# Altium project Main_Board.PrjPcb (part 18 of 44)
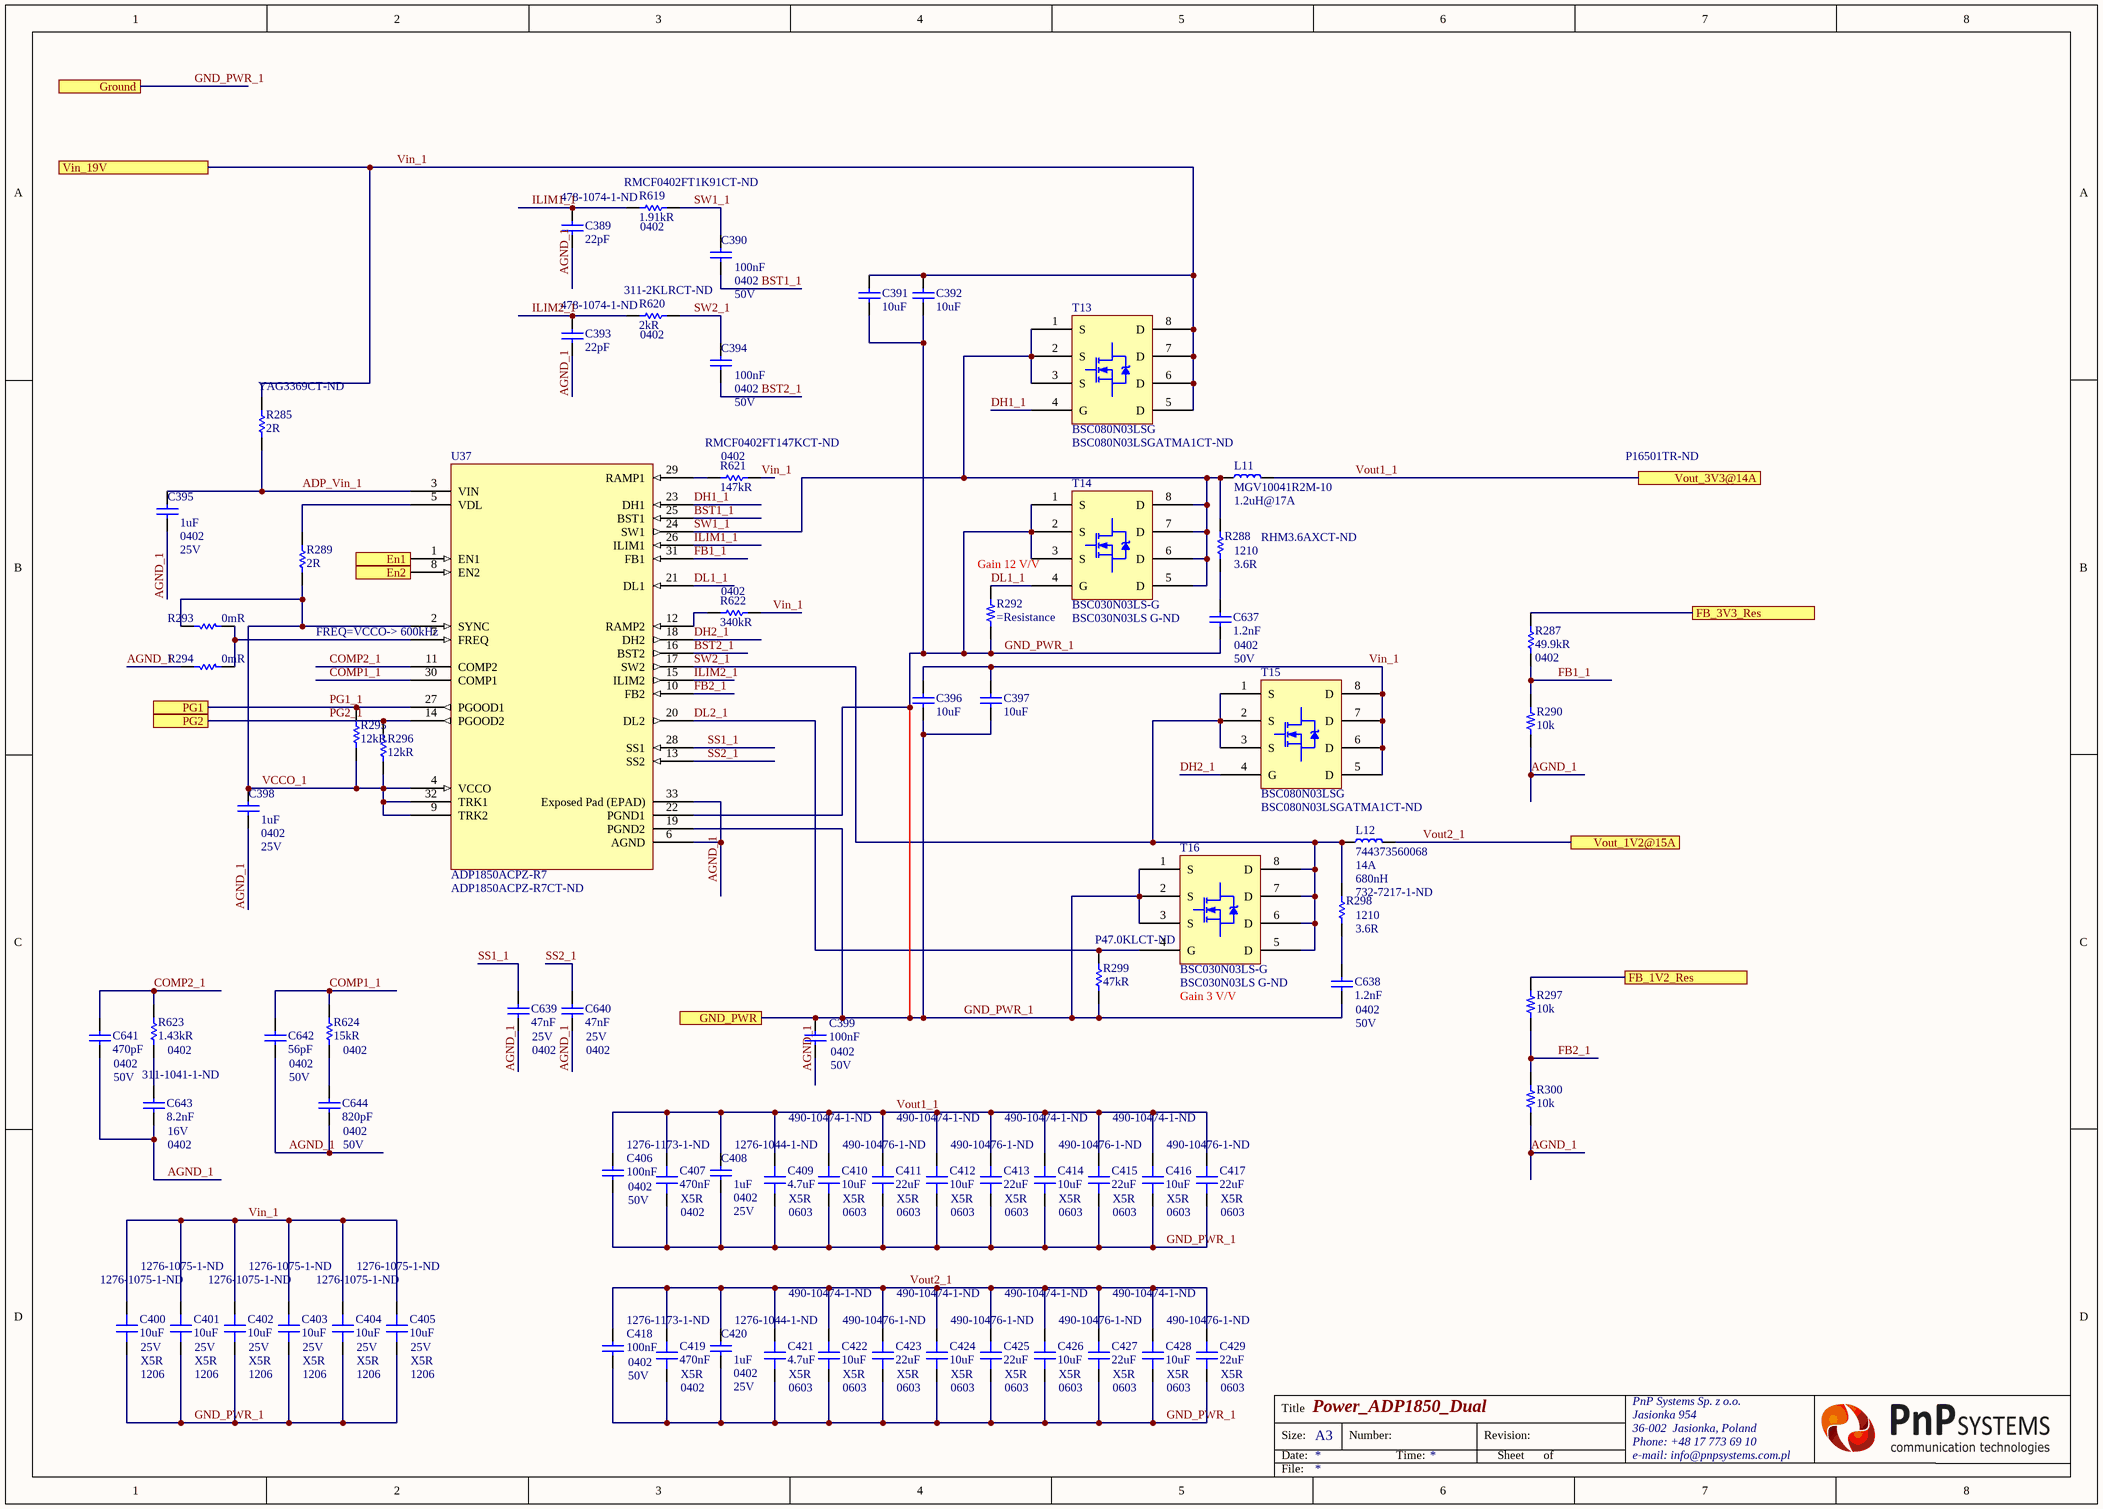
[diagram p129: Power_ADP1850_Dual.SchDoc]

## Sheet Power_ADP1850_Dual.SchDoc: Power_ADP1850_Dual (continued)

### Library data of the parts (continued)
R624 = Resistor: Manufacturer: Panasonic; Manufacturer Part Number: ERJ-2RKF1502X; Tolerance: 1%; Voltage Rating: 50V; Power Rating: 100mW; Temperature Coefficient: 100ppm/°C; Supplier 1: Digi-Key; Supplier Part Number 1: P15.0KLDKR-ND; Stock 1: 3339464; Pricing 1: 1 = 0,10000, 10 = 0,04100, 100 = 0,01670, 1000 = 0,00751, 2500 = 0,00652, 5000 = 0,00538 (USD); RoHS: Yes; Mount: Surface Mount; Case/Package: 0402; Number of Pins: 2; Weight: 2.8E-05oz; Case Code (Metric): 1005; Contact Plating: Tin; Min Operating Temperature: -55°C; Max Operating Temperature: 155°C; Resistance: 15kR; Packaging: Tape and Reel; Package Quantity: 1; Composition: Thick Film; Termination: SMD/SMT; Number of Terminations: 2; Military Standard: Not; Max Power Dissipation: 100mW; Voltage Rating (DC): 50V; Features: Automotive AEC-Q200; Length: 1mm; Height: 0.35mm; Width: 0.5mm; Depth: 0.5mm; Radiation Hardening: No; REACH SVHC: No SVHC; Lead Free: Lead Free; ComponentLink1URL: https://datasheet.ciiva.com/11821/0900766b80f80784-11821181.pdf?src-supplier=RSComponents; ComponentLink1Description: https://datasheet.ciiva.com/11821/0900766b80f80784-11821181.pdf?src-supplier=RSComponents; ComponentLink2URL: https://datasheet.ciiva.com/16778/70260748-16778682.pdf?src-supplier=Allied+Electronics; ComponentLink2Description: https://datasheet.ciiva.com/16778/70260748-16778682.pdf?src-supplier=Allied+Electronics; ComponentLink3URL: https://datasheet.ciiva.com/46372/1678782-46372862.pdf?src-supplier=Element14; ComponentLink3Description: https://datasheet.ciiva.com/46372/1678782-46372862.pdf?src-supplier=Element14; ComponentLink4URL: https://datasheet.ciiva.com/17211/aoa0000ce2-17211535.pdf?src-supplier=Avnet+Europe; ComponentLink4Description: https://datasheet.ciiva.com/17211/aoa0000ce2-17211535.pdf?src-supplier=Avnet+Europe; ComponentLink5URL: https://datasheet.ciiva.com/46372/1678782-46372863.pdf?src-supplier=Element14; ComponentLink5Description: https://datasheet.ciiva.com/46372/1678782-46372863.pdf?src-supplier=Element14; ComponentLink6URL: https://datasheet.ciiva.com/6138/aoa0000ce2-6138166.pdf?src-supplier=Farnell; ComponentLink6Description: https://datasheet.ciiva.com/6138/aoa0000ce2-6138166.pdf?src-supplier=Farnell; ComponentLink7URL: https://datasheet.ciiva.com/16765/70260748-16765542.pdf?src-supplier=Allied+Electronics; ComponentLink7Description: https://datasheet.ciiva.com/16765/70260748-16765542.pdf?src-supplier=Allied+Electronics; ComponentLink8URL: https://datasheet.ciiva.com/43467/1678782-43467414.pdf?src-supplier=Farnell; ComponentLink8Description: https://datasheet.ciiva.com/43467/1678782-43467414.pdf?src-supplier=Farnell; ComponentLink9URL: https://datasheet.ciiva.com/9193/aoa0000ce2-9193047.pdf?src-supplier=Avnet; ComponentLink9Description: https://datasheet.ciiva.com/9193/aoa0000ce2-9193047.pdf?src-supplier=Avnet; ComponentLink10URL: https://datasheet.ciiva.com/8079/426256-8079609.pdf?src-supplier=Element14; ComponentLink10Description: https://datasheet.ciiva.com/8079/426256-8079609.pdf?src-supplier=Element14; ComponentLink11URL: https://datasheet.ciiva.com/16371/aoa0000ce2-16371499.pdf?src-supplier=Future+Electronics; ComponentLink11Description: https://datasheet.ciiva.com/16371/aoa0000ce2-16371499.pdf?src-supplier=Future+Electronics; ComponentLink12URL: https://datasheet.ciiva.com/22687/1678782-22687068.pdf?src-supplier=Element14; ComponentLink12Description: https://datasheet.ciiva.com/22687/1678782-22687068.pdf?src-supplier=Element14
T13 T15 = BSC080N03LSG: as T5 on sheet HI_Curr_ADP1850; Supplier 1: Digi-Key; Manufacturer Part Number 1: BSC080N03LSG; Stock 1: 16105; Pricing 1: 1=0,70000, 10=0,61600, 100=0,42020, 500=0,35108, 1000=0,29878 (USD); RoHS: Yes; Number of Pins: 8; Min Operating Temperature: -55°C; Max Operating Temperature: 150°C; Packaging: Tape and Reel; Drain to Source Voltage (Vdss): 30V; Continuous Drain Current (ID): 53A; Package Quantity: 1; Drain to Source Breakdown Voltage: 30V; Drain to Source Resistance: 8mR; Length: 6.35mm; Height: 1.1mm; Width: 5.35mm; Halogen Free: Halogen Free; REACH SVHC: No SVHC; ComponentLink1URL: https://datasheet.ciiva.com/1189/infineon-bsc080n03ls-ds-v02-01-en-1189645.pdf?src-supplier=Element14; ComponentLink1Description: https://datasheet.ciiva.com/1189/infineon-bsc080n03ls-ds-v02-01-en-1189645.pdf?src-supplier=Element14; ComponentLink2URL: https://datasheet.ciiva.com/26789/bsc080n03ls-g-26789476.pdf?src-supplier=IIIC; ComponentLink2Description: https://datasheet.ciiva.com/26789/bsc080n03ls-g-26789476.pdf?src-supplier=IIIC
T14 T16 = BSC030N03LS-G: as T7 on sheet HI_Curr_ADP1850; RoHS: Yes; Case/Package: TO-252-3; Number of Pins: 8; Contact Plating: Tin; Min Operating Temperature: -55°C; Max Operating Temperature: 150°C; Packaging: Tape and Reel; Continuous Drain Current (ID): 100A; Package Quantity: 5000; Drain to Source Breakdown Voltage: 30V; Length: 5.35mm; Height: 1.1mm; Width: 6.35mm; Radiation Hardening: No; Halogen Free: Halogen Free; Lead Free: Lead Free; REACH SVHC: No SVHC; ComponentLink1URL: https://datasheet.ciiva.com/26896/getdatasheetpartid-635090-26896521.pdf?src-supplier=Verical; ComponentLink1Description: https://datasheet.ciiva.com/26896/getdatasheetpartid-635090-26896521.pdf?src-supplier=Verical; ComponentLink2URL: https://datasheet.ciiva.com/26790/bsc030n03ls-g-26790009.pdf?src-supplier=IIIC; ComponentLink2Description: https://datasheet.ciiva.com/26790/bsc030n03ls-g-26790009.pdf?src-supplier=IIIC; ComponentLink3URL: https://datasheet.ciiva.com/6368/bsc030n03ls-rev1-27-6368951.pdf?src-supplier=Digi-Key; ComponentLink3Description: https://datasheet.ciiva.com/6368/bsc030n03ls-rev1-27-6368951.pdf?src-supplier=Digi-Key; ComponentLink4URL: https://datasheet.ciiva.com/6368/bsc030n03ls-rev1-27-6368952.pdf?src-supplier=Digi-Key; ComponentLink4Description: https://datasheet.ciiva.com/6368/bsc030n03ls-rev1-27-6368952.pdf?src-supplier=Digi-Key; ComponentLink5URL: https://datasheet.ciiva.com/11172/bsc030n03ls-rev1-27-11172568.pdf?src-supplier=Avnet; ComponentLink5Description: https://datasheet.ciiva.com/11172/bsc030n03ls-rev1-27-11172568.pdf?src-supplier=Avnet; ComponentLink6URL: https://datasheet.ciiva.com/11172/bsc030n03ls-rev1-27-11172569.pdf?src-supplier=Avnet; ComponentLink6Description: https://datasheet.ciiva.com/11172/bsc030n03ls-rev1-27-11172569.pdf?src-supplier=Avnet; ComponentLink7URL: https://datasheet.ciiva.com/6368/bsc030n03ls-rev1-27-6368954.pdf?src-supplier=Digi-Key; ComponentLink7Description: https://datasheet.ciiva.com/6368/bsc030n03ls-rev1-27-6368954.pdf?src-supplier=Digi-Key; Supplier 1: Digi-Key; Manufacturer Part Number 1: BSC030N03LS-G; Stock 1: 0
U37 = ADP1850ACPZ-R7: as U34 on sheet HI_Curr_ADP1850; Supplier 1: Digi-Key; Manufacturer 1: Analog Devices; Manufacturer Part Number 1: ADP1850ACPZ-R7; Stock 1: 1022; Pricing 1: 1=4,61000, 10=4,14300, 25=3,91640, 100=3,39440, 250=3,22028, 500=2,88956 (USD); RoHS: Yes; Case/Package: LFCSP EP; Number of Pins: 32; Contact Plating: Tin,Matte; Min Operating Temperature: -40°C; Max Operating Temperature: 85°C; Packaging: Tape and Reel; Number of Output Phases: 2; Clock Sync: Yes; Max Input Voltage: 20V; Min Input Voltage: 2.75V; Radiation Hardening: No; REACH SVHC: No SVHC; Lead Free: Contains Lead; ComponentLink1URL: https://datasheet.ciiva.com/3217/adp1850-3217744.pdf?src-supplier=Avnet; ComponentLink1Description: https://datasheet.ciiva.com/3217/adp1850-3217744.pdf?src-supplier=Avnet; ComponentLink2URL: https://datasheet.ciiva.com/8306/adp1850-8306183.pdf?src-supplier=Avnet; ComponentLink2Description: https://datasheet.ciiva.com/8306/adp1850-8306183.pdf?src-supplier=Avnet; ComponentLink3URL: https://datasheet.ciiva.com/2015/adp1850-2015067.pdf?src-supplier=Digi-Key; ComponentLink3Description: https://datasheet.ciiva.com/2015/adp1850-2015067.pdf?src-supplier=Digi-Key; ComponentLink4URL: https://datasheet.ciiva.com/17297/adp1850-17297115.pdf?src-supplier=Avnet+Europe; ComponentLink4Description: https://datasheet.ciiva.com/17297/adp1850-17297115.pdf?src-supplier=Avnet+Europe; ComponentLink5URL: https://datasheet.ciiva.com/2015/adp1850-2015068.pdf?src-supplier=Digi-Key; ComponentLink5Description: https://datasheet.ciiva.com/2015/adp1850-2015068.pdf?src-supplier=Digi-Key; ComponentLink6URL: https://datasheet.ciiva.com/2015/adp1850-2015069.pdf?src-supplier=Digi-Key; ComponentLink6Description: https://datasheet.ciiva.com/2015/adp1850-2015069.pdf?src-supplier=Digi-Key

## Sheet Power_ADP1850_Dual_1.SchDoc
size A3
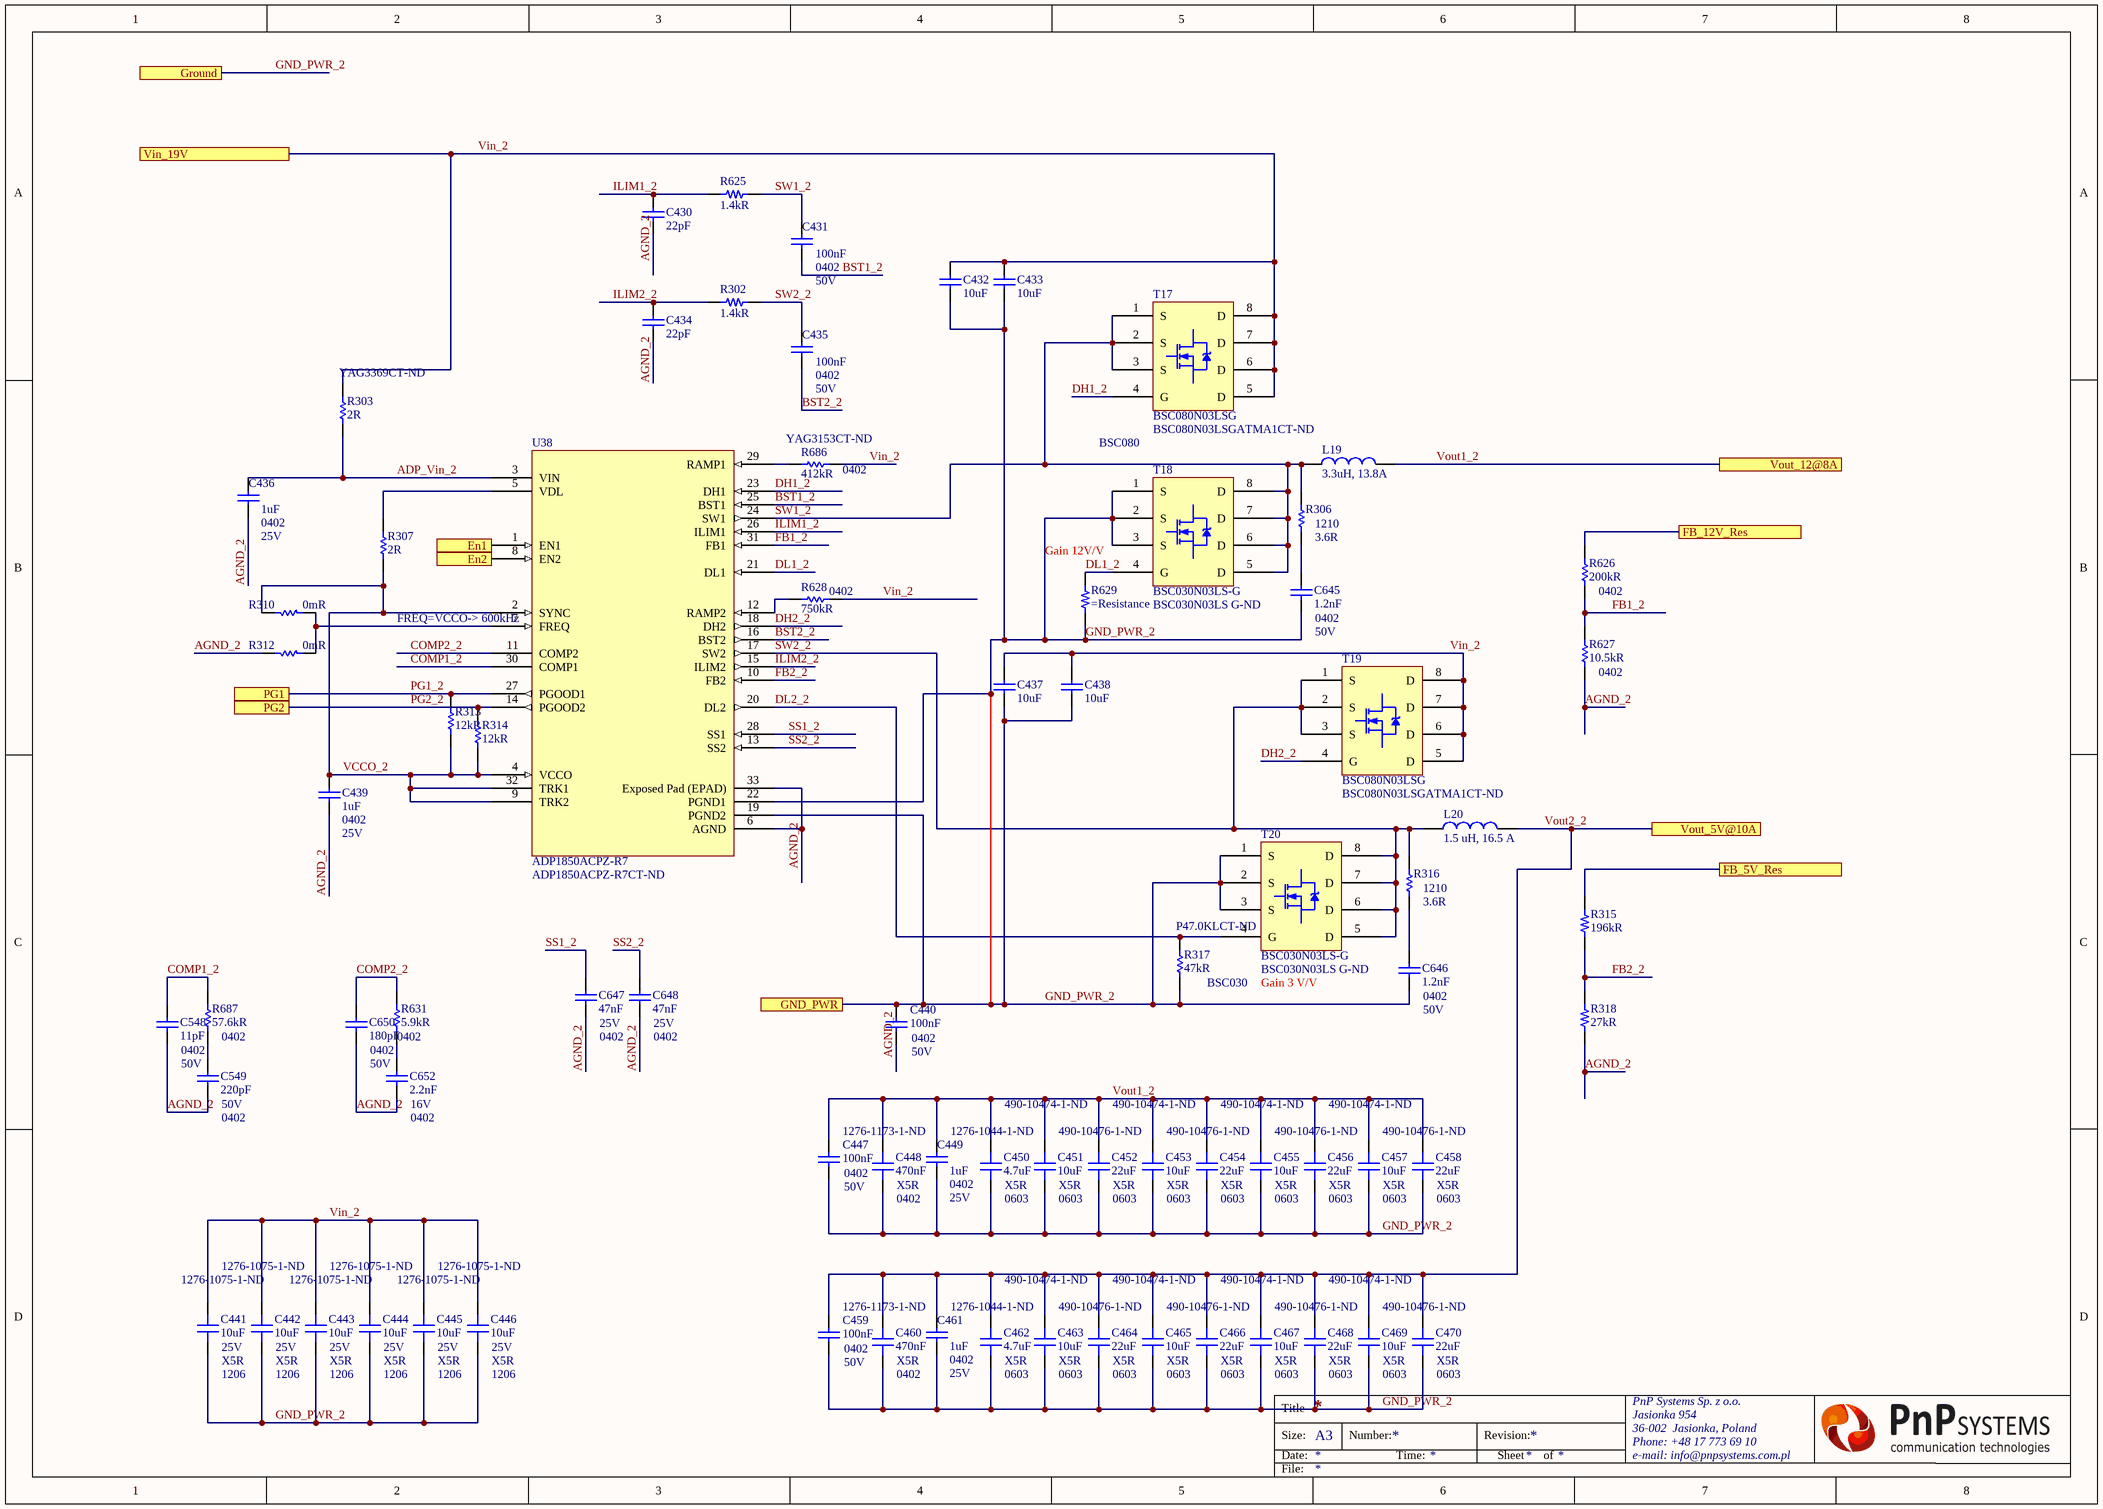
[diagram p25: Power_ADP1850_Dual_1.SchDoc]

### Parts
C430  22pF  [CAP 0402/1005 KK]
C431  100nF  Case Code (Imperial): 0402  Voltage: 50V  [CAP 0402/1005 KK]
C432  10uF  [CAP 1206/3216]
C433  10uF  [CAP 1206/3216]
C434  22pF  [CAP 0402/1005 KK]
C435  100nF  Case Code (Imperial): 0402  Voltage: 50V  [CAP 0402/1005 KK]
C436  1uF  Case/Package: 0402  Voltage Rating: 25V  [CAP 0402/1005 KK]
C437  10uF  [CAP 1206/3216]
C438  10uF  [CAP 1206/3216]
C439  1uF  Case/Package: 0402  Voltage Rating: 25V  [CAP 0402/1005 KK]
C440  100nF  Case Code (Imperial): 0402  Voltage: 50V  [CAP 0402/1005 KK]
C441  10uF  Supplier Part Number 1: 1276-1075-1-ND  Case/Package: 1206  Dielectric: X5R  Voltage: 25V  [CAP 1206/3216 - 0.8MM]
C442  10uF  Supplier Part Number 1: 1276-1075-1-ND  Case/Package: 1206  Dielectric: X5R  Voltage: 25V  [CAP 1206/3216 - 0.8MM]
C443  10uF  Supplier Part Number 1: 1276-1075-1-ND  Case/Package: 1206  Dielectric: X5R  Voltage: 25V  [CAP 1206/3216 - 0.8MM]
C444  10uF  Supplier Part Number 1: 1276-1075-1-ND  Case/Package: 1206  Dielectric: X5R  Voltage: 25V  [CAP 1206/3216 - 0.8MM]
C445  10uF  Supplier Part Number 1: 1276-1075-1-ND  Case/Package: 1206  Dielectric: X5R  Voltage: 25V  [CAP 1206/3216 - 0.8MM]
C446  10uF  Supplier Part Number 1: 1276-1075-1-ND  Case/Package: 1206  Dielectric: X5R  Voltage: 25V  [CAP 1206/3216 - 0.8MM]
C447  100nF  Case Code (Imperial): 0402  Voltage: 50V  [CAP 0402/1005 KK]
C448  470nF  Supplier Part Number 1: 1276-1173-1-ND  Case/Package: 0402  Dielectric: X5R  [CAP 0402/1005 KK]
C449  1uF  Case/Package: 0402  Voltage Rating: 25V  [CAP 0402/1005 KK]
C450  4.7uF  Supplier Part Number 1: 1276-1044-1-ND  Case/Package: 0603  Dielectric: X5R  [CAP 0603/1608 RF]
C451  10uF  Supplier Part Number 1: 490-10474-1-ND  Case/Package: 0603  Dielectric: X5R  [CAP 0603/1608 RF]
C452  22uF  Supplier Part Number 1: 490-10476-1-ND  Case/Package: 0603  Dielectric: X5R  [CAP 0603/1608 RF]
C453  10uF  Supplier Part Number 1: 490-10474-1-ND  Case/Package: 0603  Dielectric: X5R  [CAP 0603/1608 RF]
C454  22uF  Supplier Part Number 1: 490-10476-1-ND  Case/Package: 0603  Dielectric: X5R  [CAP 0603/1608 RF]
C455  10uF  Supplier Part Number 1: 490-10474-1-ND  Case/Package: 0603  Dielectric: X5R  [CAP 0603/1608 RF]
C456  22uF  Supplier Part Number 1: 490-10476-1-ND  Case/Package: 0603  Dielectric: X5R  [CAP 0603/1608 RF]
C457  10uF  Supplier Part Number 1: 490-10474-1-ND  Case/Package: 0603  Dielectric: X5R  [CAP 0603/1608 RF]
C458  22uF  Supplier Part Number 1: 490-10476-1-ND  Case/Package: 0603  Dielectric: X5R  [CAP 0603/1608 RF]
C459  100nF  Case Code (Imperial): 0402  Voltage: 50V  [CAP 0402/1005 KK]
C460  470nF  Supplier Part Number 1: 1276-1173-1-ND  Case/Package: 0402  Dielectric: X5R  [CAP 0402/1005 KK]
C461  1uF  Case/Package: 0402  Voltage Rating: 25V  [CAP 0402/1005 KK]
C462  4.7uF  Supplier Part Number 1: 1276-1044-1-ND  Case/Package: 0603  Dielectric: X5R  [CAP 0603/1608 RF]
C463  10uF  Supplier Part Number 1: 490-10474-1-ND  Case/Package: 0603  Dielectric: X5R  [CAP 0603/1608 RF]
C464  22uF  Supplier Part Number 1: 490-10476-1-ND  Case/Package: 0603  Dielectric: X5R  [CAP 0603/1608 RF]
C465  10uF  Supplier Part Number 1: 490-10474-1-ND  Case/Package: 0603  Dielectric: X5R  [CAP 0603/1608 RF]
C466  22uF  Supplier Part Number 1: 490-10476-1-ND  Case/Package: 0603  Dielectric: X5R  [CAP 0603/1608 RF]
C467  10uF  Supplier Part Number 1: 490-10474-1-ND  Case/Package: 0603  Dielectric: X5R  [CAP 0603/1608 RF]
C468  22uF  Supplier Part Number 1: 490-10476-1-ND  Case/Package: 0603  Dielectric: X5R  [CAP 0603/1608 RF]
C469  10uF  Supplier Part Number 1: 490-10474-1-ND  Case/Package: 0603  Dielectric: X5R  [CAP 0603/1608 RF]
C470  22uF  Supplier Part Number 1: 490-10476-1-ND  Case/Package: 0603  Dielectric: X5R  [CAP 0603/1608 RF]
C548  11pF  Case/Package: 0402  Voltage Rating: 50V  [CAP 0402/1005 KK]
C549  220pF  Case Code (Imperial): 0402  Voltage Rating: 50V  [CAP 0402/1005 KK]
C645  1.2nF  Case/Package: 0402  Voltage Rating (DC): 50V  [CAP 0402/1005 KK]
C646  1.2nF  Case/Package: 0402  Voltage Rating (DC): 50V  [CAP 0402/1005 KK]
C647  47nF  Case Code (Imperial): 0402  Voltage Rating: 25V  [CAP 0402/1005 KK]
C648  47nF  Case Code (Imperial): 0402  Voltage Rating: 25V  [CAP 0402/1005 KK]
C650  180pF  Case Code (Imperial): 0402  Voltage Rating: 50V  [CAP 0402/1005 KK]
C652  2.2nF  Case Code (Imperial): 0402  Voltage Rating: 16V  [CAP 0402/1005 KK]
L19  3.3uH, 13.8A  [WE-CHSA_1011]
L20  1.5 uH, 16.5 A  [WE-HCC_8070]
R302  1.4kR  [RES 0201/0603]
R303  2R  Supplier Part Number 1: YAG3369CT-ND  [RES 0402/1005 RF KK]
R306  value 3.6R  Case/Package: 1210  [RES_1210]  (hidden comment: Resistor_1210)
R307  2R  [RES 0402/1005 RF KK]
R310  0mR  [RES 0402/1005 RF KK]
R312  0mR  [RES 0402/1005 RF KK]
R313  12kR  [RES 0402/1005 RF KK]
R314  12kR  [RES 0402/1005 RF KK]
R315  196kR  [RES 0402/1005 RF KK]
R316  value 3.6R  Case/Package: 1210  [RES_1210]  (hidden comment: Resistor_1210)
R317  47kR  Supplier Part Number 1: P47.0KLCT-ND  [RES 0402/1005 RF KK]
R318  27kR  [RES 0402/1005 RF KK]
R625  1.4kR  [RES 0201/0603]
R626  200kR  Case/Package: 0402  [RES 0402/1005 RF KK]
R627  10.5kR  Case Code (Imperial): 0402  [RES 0402/1005 RF KK]
R628  750kR  Case Code (Imperial): 0402  [RES 0402/1005 RF KK]
R629  (no value)  [RES 0402/1005 RF KK]
R631  5.9kR  Case Code (Imperial): 0402  [RES 0402/1005 RF KK]
R686  412kR  Supplier Part Number 1: YAG3153CT-ND  Case Code (Imperial): 0402  [RES 0402/1005 RF KK]
R687  57.6kR  Case Code (Imperial): 0402  [RES 0402/1005 RF KK]
T17  BSC080N03LSG  Supplier Part Number 1: BSC080N03LSGATMA1CT-ND  [BSC080N03LS]
T18  BSC030N03LS-G  Supplier Part Number 1: BSC030N03LS G-ND  [BSC030N03LS]
T19  BSC080N03LSG  Supplier Part Number 1: BSC080N03LSGATMA1CT-ND  [BSC080N03LS]
T20  BSC030N03LS-G  Supplier Part Number 1: BSC030N03LS G-ND  [BSC030N03LS]
U38  ADP1850ACPZ-R7  Supplier Part Number 1: ADP1850ACPZ-R7CT-ND  [ADP1850]

### Ports
En1, En2, FB_5V_Res, FB_12V_Res, GND_PWR, Ground, PG1, PG2, Vin_19V, Vout_5V@10A, Vout_12@8A

### Nets
GND_PWR_2: C432.2 C433.1 C437.1 C438.2 C440.2 C441.1 C442.1 C443.1 C444.1 C445.1 C446.1 C447.1 C448.1 C449.2 C450.1 C451.1 C452.1 C453.1 C454.1 C455.1 C456.1 C457.1 C458.1 C459.1 C460.1 C461.2 C462.1 C463.1 C464.1 C465.1 C466.1 C467.1 C468.1 C469.1 C470.1 C645.1 C646.1 R317.1 R629.1 T18.1(S) T18.2(S) T18.3(S) T20.1(S) T20.2(S) T20.3(S) U38.19(PGND2) U38.22(PGND1) ; port Ground, port GND_PWR  [project net B503_Ground]
5V_RAIL: R315.2 ; port FB_5V_Res
12V_LT3042: R626.2 ; port FB_12V_Res
ADP_Vin_2: C436.1 R303.2 U38.3(VIN)
AGND_2: C430.1 C434.1 C436.2 C439.2 C440.1 C548.1 C549.1 C647.1 C648.1 C650.1 C652.1 R312.2 R318.1 R627.1 U38.6(AGND) U38.33(Exposed_Pad_(EPAD))
BST1_2: C431.1 U38.25(BST1)
BST2_2: C435.1 U38.16(BST2)
COMP1_2: C548.2 R687.2 U38.30(COMP1)
COMP2_2: C650.2 R631.2 U38.11(COMP2)
DH1_2: T17.4(G) U38.23(DH1)
DH2_2: T19.4(G) U38.18(DH2)
DL1_2: R629.2 T18.4(G) U38.21(DL1)
DL2_2: R317.2 T20.4(G) U38.20(DL2)
EN_5V_REG0: U38.8(EN2) ; port En2
EN_12@8A: U38.1(EN1) ; port En1
FB1_2: R626.1 R627.2 U38.31(FB1)
FB2_2: R315.1 R318.2 U38.10(FB2)
ILIM1_2: C430.2 R625.2 U38.26(ILIM1)
ILIM2_2: C434.2 R302.2 U38.15(ILIM2)
PG1_2: R313.2 U38.27(PGOOD1) ; port PG1
PG2_2: R314.2 U38.14(PGOOD2) ; port PG2
SS1_2: C647.2 U38.28(SS1)
SS2_2: C648.2 U38.13(SS2)
SW1_2: C431.2 L19.1 R306.2 R625.1 T17.1(S) T17.2(S) T17.3(S) T18.5(D) T18.6(D) T18.7(D) T18.8(D) U38.24(SW1)
SW2_2: C435.2 L20.1 R302.1 R316.2 T19.1(S) T19.2(S) T19.3(S) T20.5(D) T20.6(D) T20.7(D) T20.8(D) U38.17(SW2)
VCCO_2: C439.1 R307.2 R310.2 R313.1 R314.1 U38.2(SYNC) U38.4(VCCO) U38.9(TRK2) U38.32(TRK1)
Vin_2: C432.1 C433.2 C437.2 C438.1 C441.2 C442.2 C443.2 C444.2 C445.2 C446.2 R303.1 R628.2 R686.2 T17.5(D) T17.6(D) T17.7(D) T17.8(D) T19.5(D) T19.6(D) T19.7(D) T19.8(D) ; port Vin_19V  [project net PWR_OUT_20V]
Vout1_2: C447.2 C448.2 C449.1 C450.2 C451.2 C452.2 C453.2 C454.2 C455.2 C456.2 C457.2 C458.2 L19.2 ; port Vout_12@8A
Vout2_2: C459.2 C460.2 C461.1 C462.2 C463.2 C464.2 C465.2 C466.2 C467.2 C468.2 C469.2 C470.2 L20.2 ; port Vout_5V@10A
NetC549_2: C549.2 R687.1
NetC645_2: C645.2 R306.1
NetC646_2: C646.2 R316.1
NetC652_2: C652.2 R631.1
NetR307_1: R307.1 U38.5(VDL)
NetR310_1: R310.1 R312.1 U38.7(FREQ)
NetR628_1: R628.1 U38.12(RAMP2)
NetR686_1: R686.1 U38.29(RAMP1)

### Notes on the sheet
- BSC080
- (near R629) Gain 12V/V
- (near U38) FREQ=VCCO-> 600kHz
- BSC030
- (near T20) Gain 3 V/V
- Title
- Size:
- Date:
- A3
- Number:
- Time:
- Revision:
- Sheet
- of
- File: